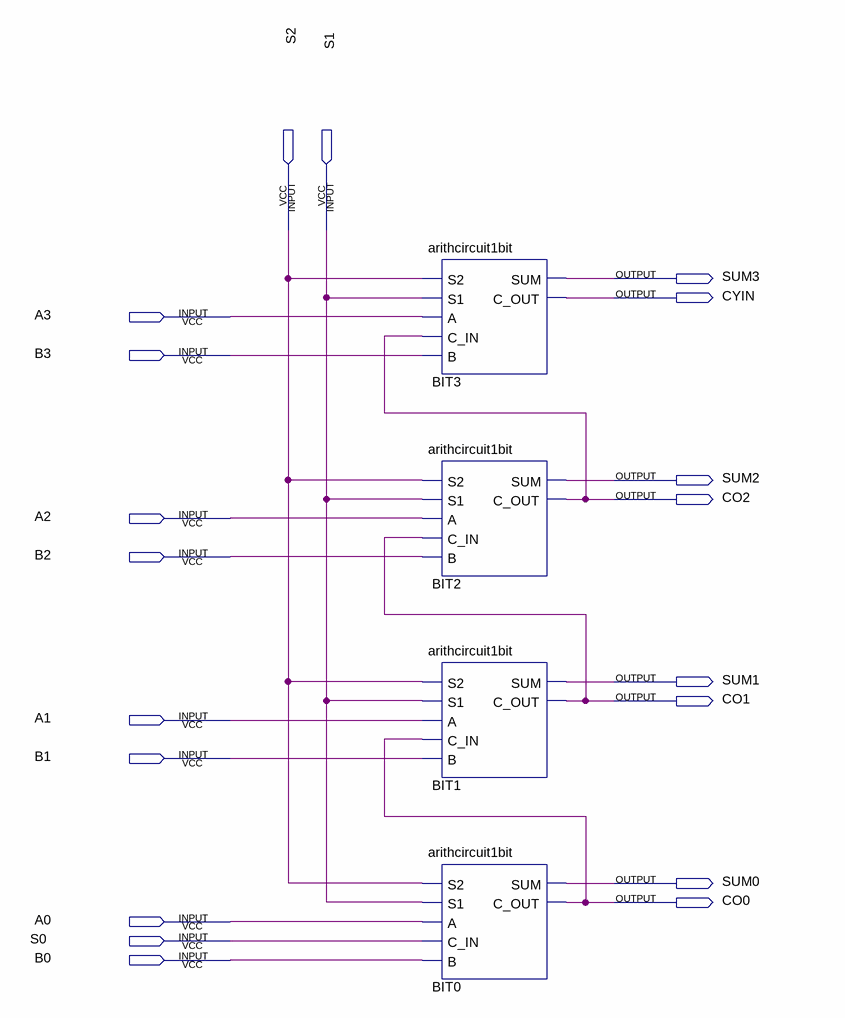
[diagram p0: schematic sheet]
// Quartus schematic arithcircuit4bit.bdf as structural Verilog: 4 symbols, 19 pins
module arithcircuit4bit (
  input  S2,
  input  S1,
  input  A3,
  input  B3,
  input  A2,
  input  B2,
  input  A1,
  input  B1,
  input  A0,
  input  S0,
  input  B0,
  output SUM3,
  output CYIN,
  output SUM2,
  output CO2,
  output SUM1,
  output CO1,
  output SUM0,
  output CO0
);

  arithcircuit1bit BIT3 (.S2(S2), .S1(S1), .A(A3), .C_IN(CO2), .B(B3), .SUM(SUM3), .C_OUT(CYIN));
  arithcircuit1bit BIT2 (.S2(S2), .S1(S1), .A(A2), .C_IN(CO1), .B(B2), .SUM(SUM2), .C_OUT(CO2));
  arithcircuit1bit BIT1 (.S2(S2), .S1(S1), .A(A1), .C_IN(CO0), .B(B1), .SUM(SUM1), .C_OUT(CO1));
  arithcircuit1bit BIT0 (.S2(S2), .S1(S1), .A(A0), .C_IN(S0), .B(B0), .SUM(SUM0), .C_OUT(CO0));
endmodule
